# EasyEDA Pro project lr1388-esp32-camera-photometer-7ba3d19c.epro

# Schematic Schematic1
Board Name: 1主控板; Create Date: 2025-08-07; Page Name: P1; Project Name: esp32相机测光计; Schematic Name: Schematic1; Update Date: 2025-08-07; Company: 嘉立创EDA; Page Size: A4; Version: V1.0
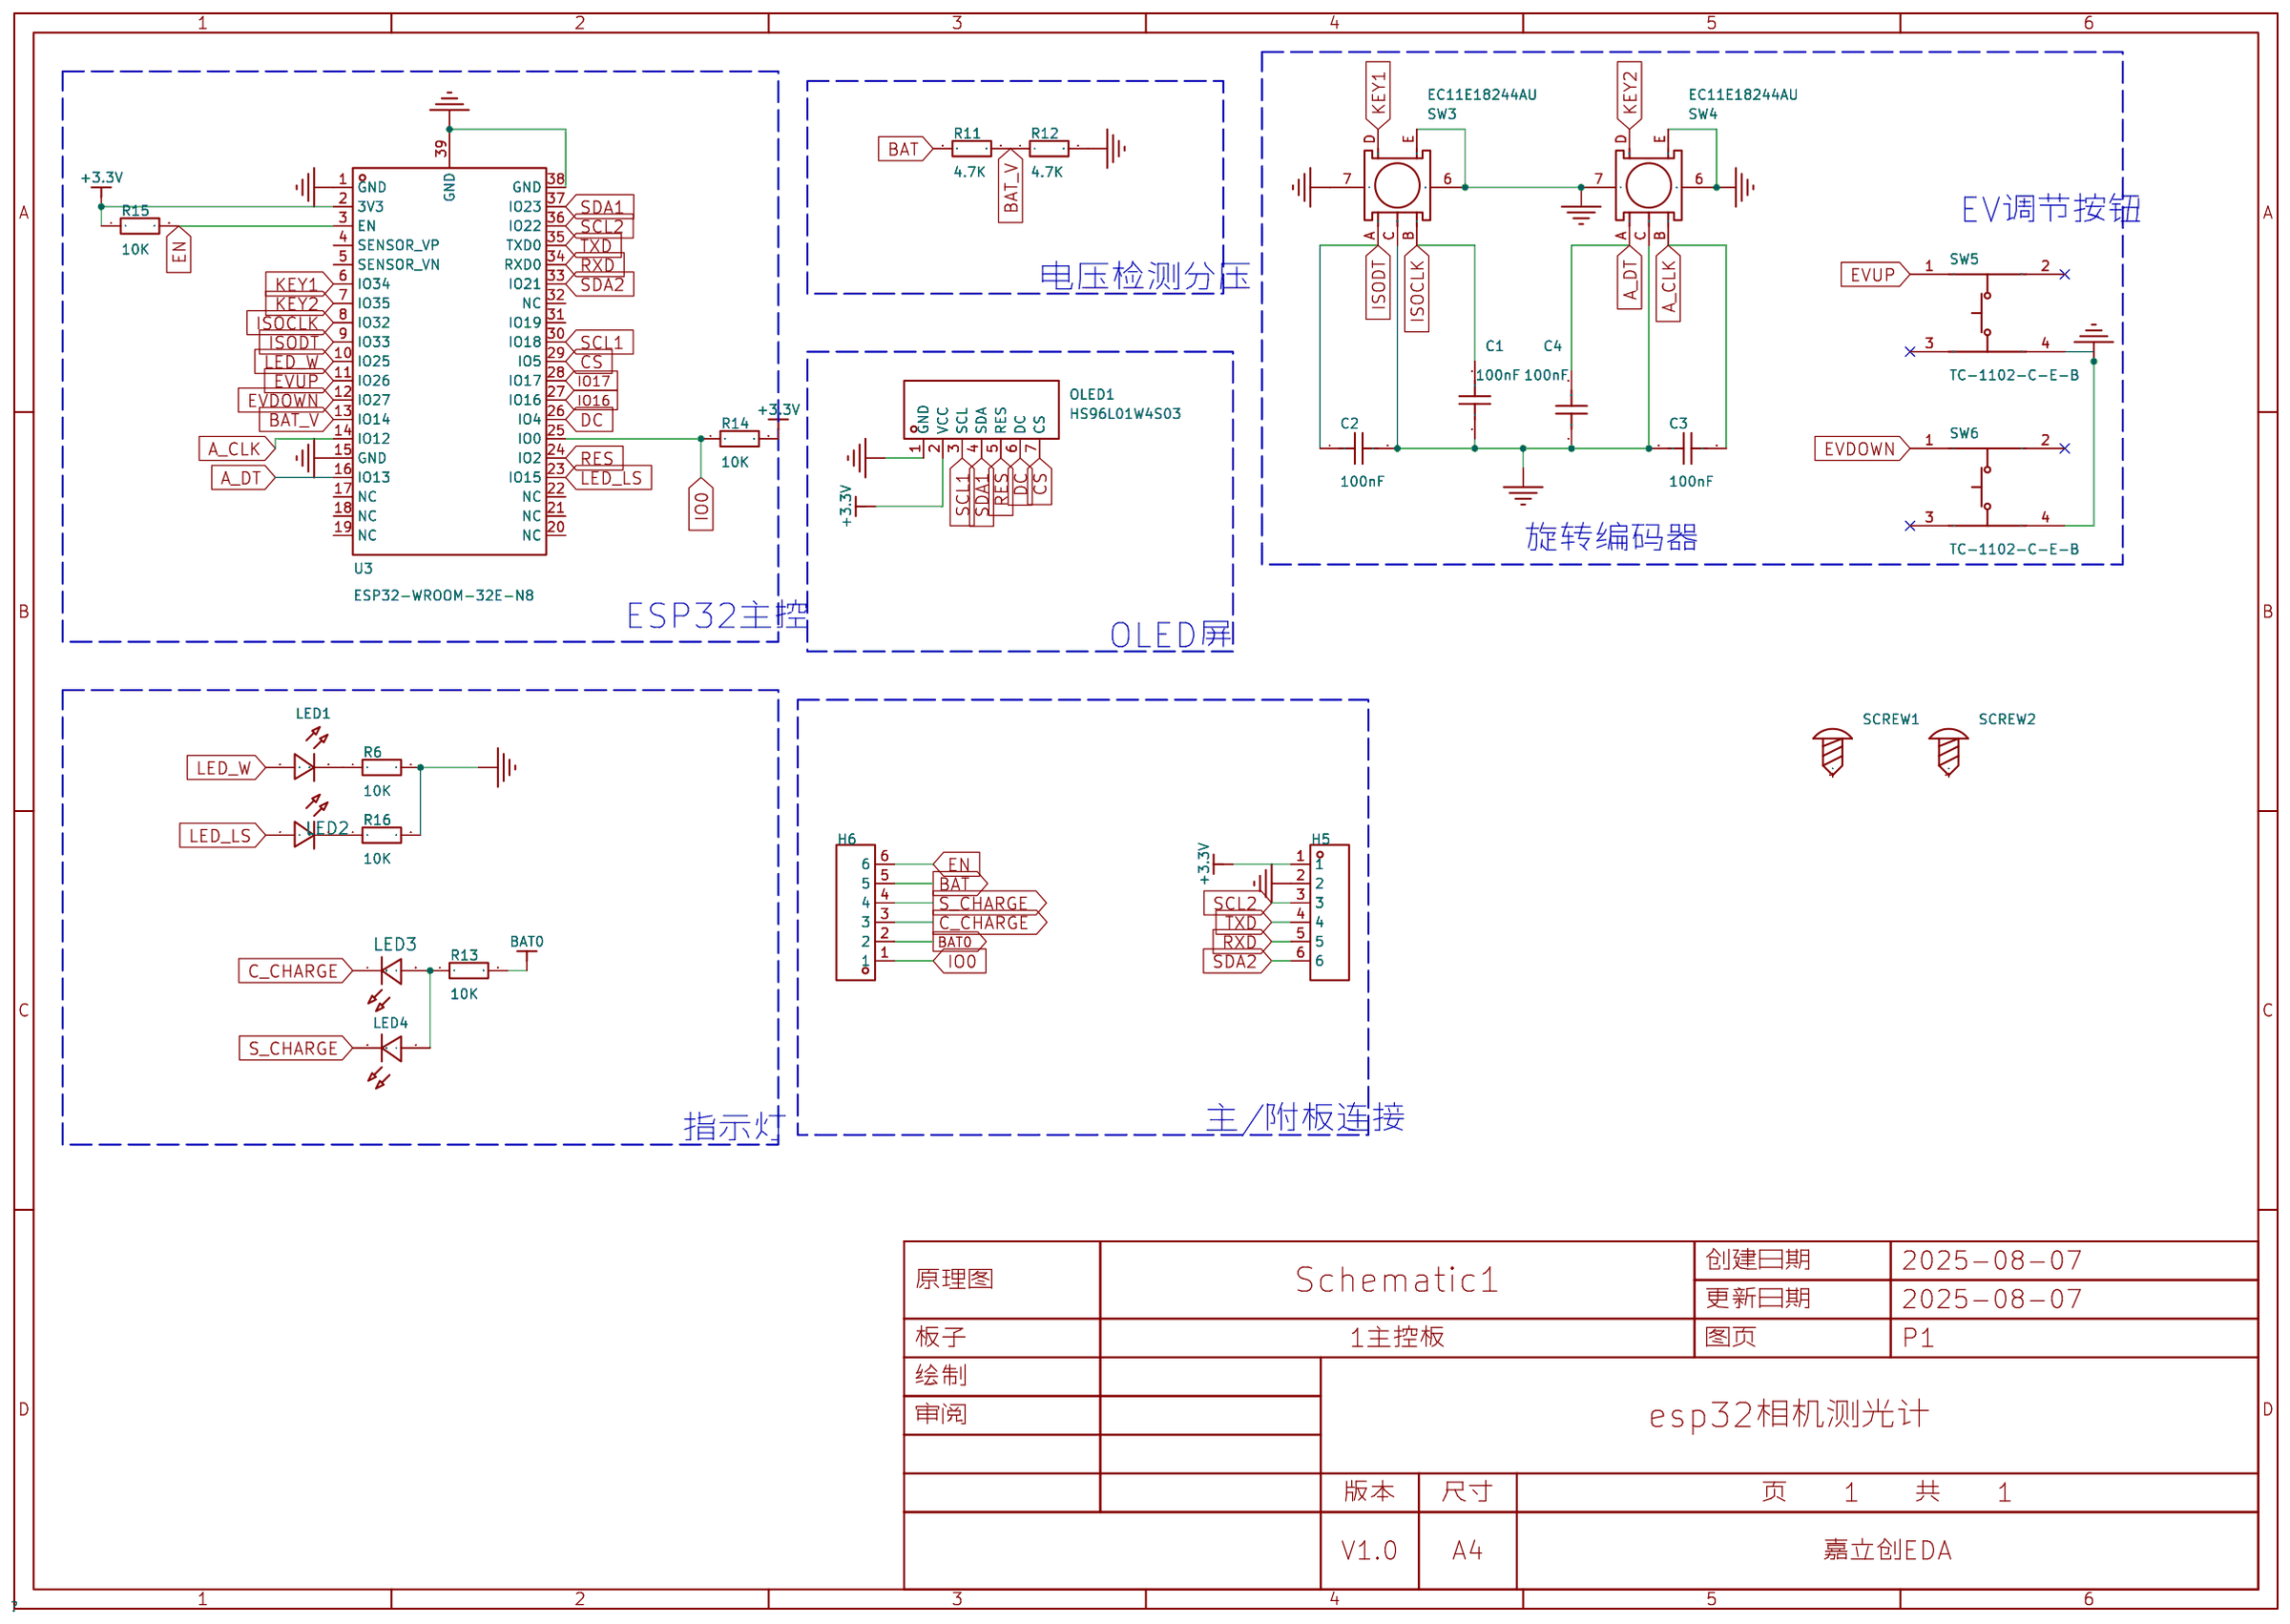
[diagram p0: schematic sheet]

## Parts
C1  100nF  [C0603]
C2  100nF  [C0603]
C3  100nF  [C0603]
C4  100nF  [C0603]
H5  -  [HDR-TH_6P-P2.54-V-F]
H6  -  [HDR-TH_6P-P2.54-V-F]
LED1  -  [LED_0603]
LED2  -  [LED_0603]
LED3  -  [LED_0603]
LED4  -  [LED_0603]
OLED1  HS96L01W4S03  [OLED-TH_HS96L01W4S03]
R6  10K  [R0603]
R11  4.7K  [R0603]
R12  4.7K  [R0603]
R13  10K  [R0603]
R14  10K  [R0603]
R15  10K  [R0603]
R16  10K  [R0603]
SCREW1  -  [M2螺丝]
SCREW2  -  [M2螺丝]
SW3  EC11E18244AU  [SW-TH_EC11XXXXXXXX]
SW4  EC11E18244AU  [SW-TH_EC11XXXXXXXX]
SW5  TC-1102-C-E-B  [KEY-TH_4P-L6.0-W6.0-P4.50-LS6.5]
SW6  TC-1102-C-E-B  [KEY-TH_4P-L6.0-W6.0-P4.50-LS6.5]
U3  ESP32-WROOM-32E-N8  [WIFI-SMD_ESP32-WROOM-32E]

## Library data of the parts
C1-C4 = CAP_0603: Supplier Footprint: 0603
H5 H6 = HDR-F_2.54_1x6P: Supplier Part: C40877; Supplier Footprint: 插件
LED1 LED4 = LED_0603-G: Supplier Footprint: 0603
LED2 LED3 = LED_0603-R: Supplier Footprint: 0603
OLED1 = HS96L01W4S03: LCSC Part Name: 0.96寸 白光 128x64像素分辨率; Supplier Part: C5139758; Manufacturer: HS(汉昇); JLCPCB Part Class: 扩展库; Datasheet: https://atta.szlcsc.com/upload/public/pdf/source/20231102/B1697FD352320B8236C71C910449C6BA.pdf; Supplier: LCSC
R6 R11-R16 = Res_0603: Supplier Footprint: 0603
SCREW1 SCREW2 = M2螺丝: Supplier Footprint: 插件
SW3 SW4 = EC11E18244AU: Supplier Part: C202365; Manufacturer: ALPSALPINE(阿尔卑斯阿尔派); Supplier Footprint: 插件; JLCPCB Part Class: 扩展库; Datasheet: https://atta.szlcsc.com/upload/public/pdf/source/20180403/C202365_70FA927E879F562641EADC151E1E414A.pdf; Supplier: LCSC
SW5 SW6 = TC-1102-C-E-B: 电路结构:单刀单掷;按钮形状:圆形按钮;作用力:260gf;安装方式:直插;开关长度:6mm;开关宽度:6mm;开关高度:6mm;带支架:不带;触点电流:50mA;额定电压(DC):12V;绝缘电阻:-;带灯:无;机械寿命:30万次;; LCSC Part Name: 6*6*6mm 直插 轻触开关; Supplier Part: C381011; Manufacturer: XKB Connectivity(中国星坤); Supplier Footprint: 插件; JLCPCB Part Class: 扩展库; Datasheet: https://atta.szlcsc.com/upload/public/pdf/source/20211011/5338952D91EAA82439B0E0118625537B.pdf; Supplier: LCSC; Circuit: 单刀单掷; Actuator Style: 圆形按钮; Operating Force: 260gf; Mounting Style: 直插; Switch Length: 6mm; Switch Width: 6mm; Switch Height: 6mm; Strike Gundam: 不带; Contact Current: 50mA; Voltage Rating (DC): 12V; Actuator/Cap Color: 黑色; With Lamp: 无; Pin Style: PC引脚; Mechanical Life: 30万次; Operating Temperature: -30℃~+85℃
U3 = ESP32-WROOM-32E-N8: ESP32-WROOM-32E 集成 ESP32-D0WD-V3 芯片，具有?高的稳定性和安全性能。; LCSC Part Name: 通用型Wi-Fi+BT+BLE MCU模组; Supplier Part: C701342; Manufacturer: ESPRESSIF(乐鑫); Supplier Footprint: SMD,18x25.5mm; JLCPCB Part Class: 扩展库; Datasheet: https://atta.szlcsc.com/upload/public/pdf/source/20240307/DEBA00FAE5BA634F0D73085E4F214E93.pdf; Supplier: LCSC

## Nets
+3.3V: H5.1 OLED1.2(VCC) R14.2 R15.1 U3.2(3V3)
GND: C1.1 C2.2 C3.1 C4.1 H5.2 OLED1.1(GND) R6.2 R12.2 R16.2 SW3.6 SW3.7 SW3.C SW3.E SW4.6 SW4.7 SW4.C SW4.E SW5.4 SW6.4 U3.1(GND) U3.15(GND) U3.38(GND) U3.39(GND)
A_CLK: C3.2 SW4.B U3.14(IO12)
A_DT: C4.2 SW4.A U3.16(IO13)
BAT: H6.5 R11.1
BAT0: H6.2 R13.2
BAT_V: R11.2 R12.1 U3.13(IO14)
C_CHARGE: H6.3 LED3.1(C)
CS: OLED1.7(CS) U3.29(IO5)
DC: OLED1.6(DC) U3.26(IO4)
EN: H6.6 R15.2 U3.3(EN)
EVDOWN: SW6.1 U3.12(IO27)
EVUP: SW5.1 U3.11(IO26)
IO0: H6.1 R14.1 U3.25(IO0)
IO16: U3.27(IO16)
IO17: U3.28(IO17)
ISOCLK: C1.2 SW3.B U3.8(IO32)
ISODT: C2.1 SW3.A U3.9(IO33)
KEY1: SW3.D U3.6(IO34)
KEY2: SW4.D U3.7(IO35)
LED_LS: LED2.2(A) U3.23(IO15)
LED_W: LED1.2(A) U3.10(IO25)
RES: OLED1.5(RES) U3.24(IO2)
RXD: H5.5 U3.34(RXD0)
S_CHARGE: H6.4 LED4.1(C)
SCL1: OLED1.3(SCL) U3.30(IO18)
SCL2: H5.3 U3.36(IO22)
SDA1: OLED1.4(SDA) U3.37(IO23)
SDA2: H5.6 U3.33(IO21)
TXD: H5.4 U3.35(TXD0)
$1N1695: LED3.2(A) LED4.2(A) R13.1
$1N1722: LED1.1(C) R6.1
$1N1723: LED2.1(C) R16.1

Not connected (* = marked no-connect by the designer): SCREW1 1; SCREW2 1; SW5 2* 3*; SW6 2* 3*; U3 4(SENSOR_VP) 5(SENSOR_VN) 17(NC) 18(NC) 19(NC) 20(NC) 21(NC) 22(NC) 31(IO19) 32(NC)

## Notes on the sheet
- EV调节按钮
- 电压检测分压
- 旋转编码器
- ESP32主控
- OLED屏
- 主/附板连接
- 指示灯

# Schematic Schematic2
Board Name: 2感光板; Create Date: 2025-08-07; Page Name: P1; Project Name: esp32相机测光计; Schematic Name: Schematic2; Update Date: 2025-08-14; Company: 嘉立创EDA; Page Size: A4; Version: V1.0
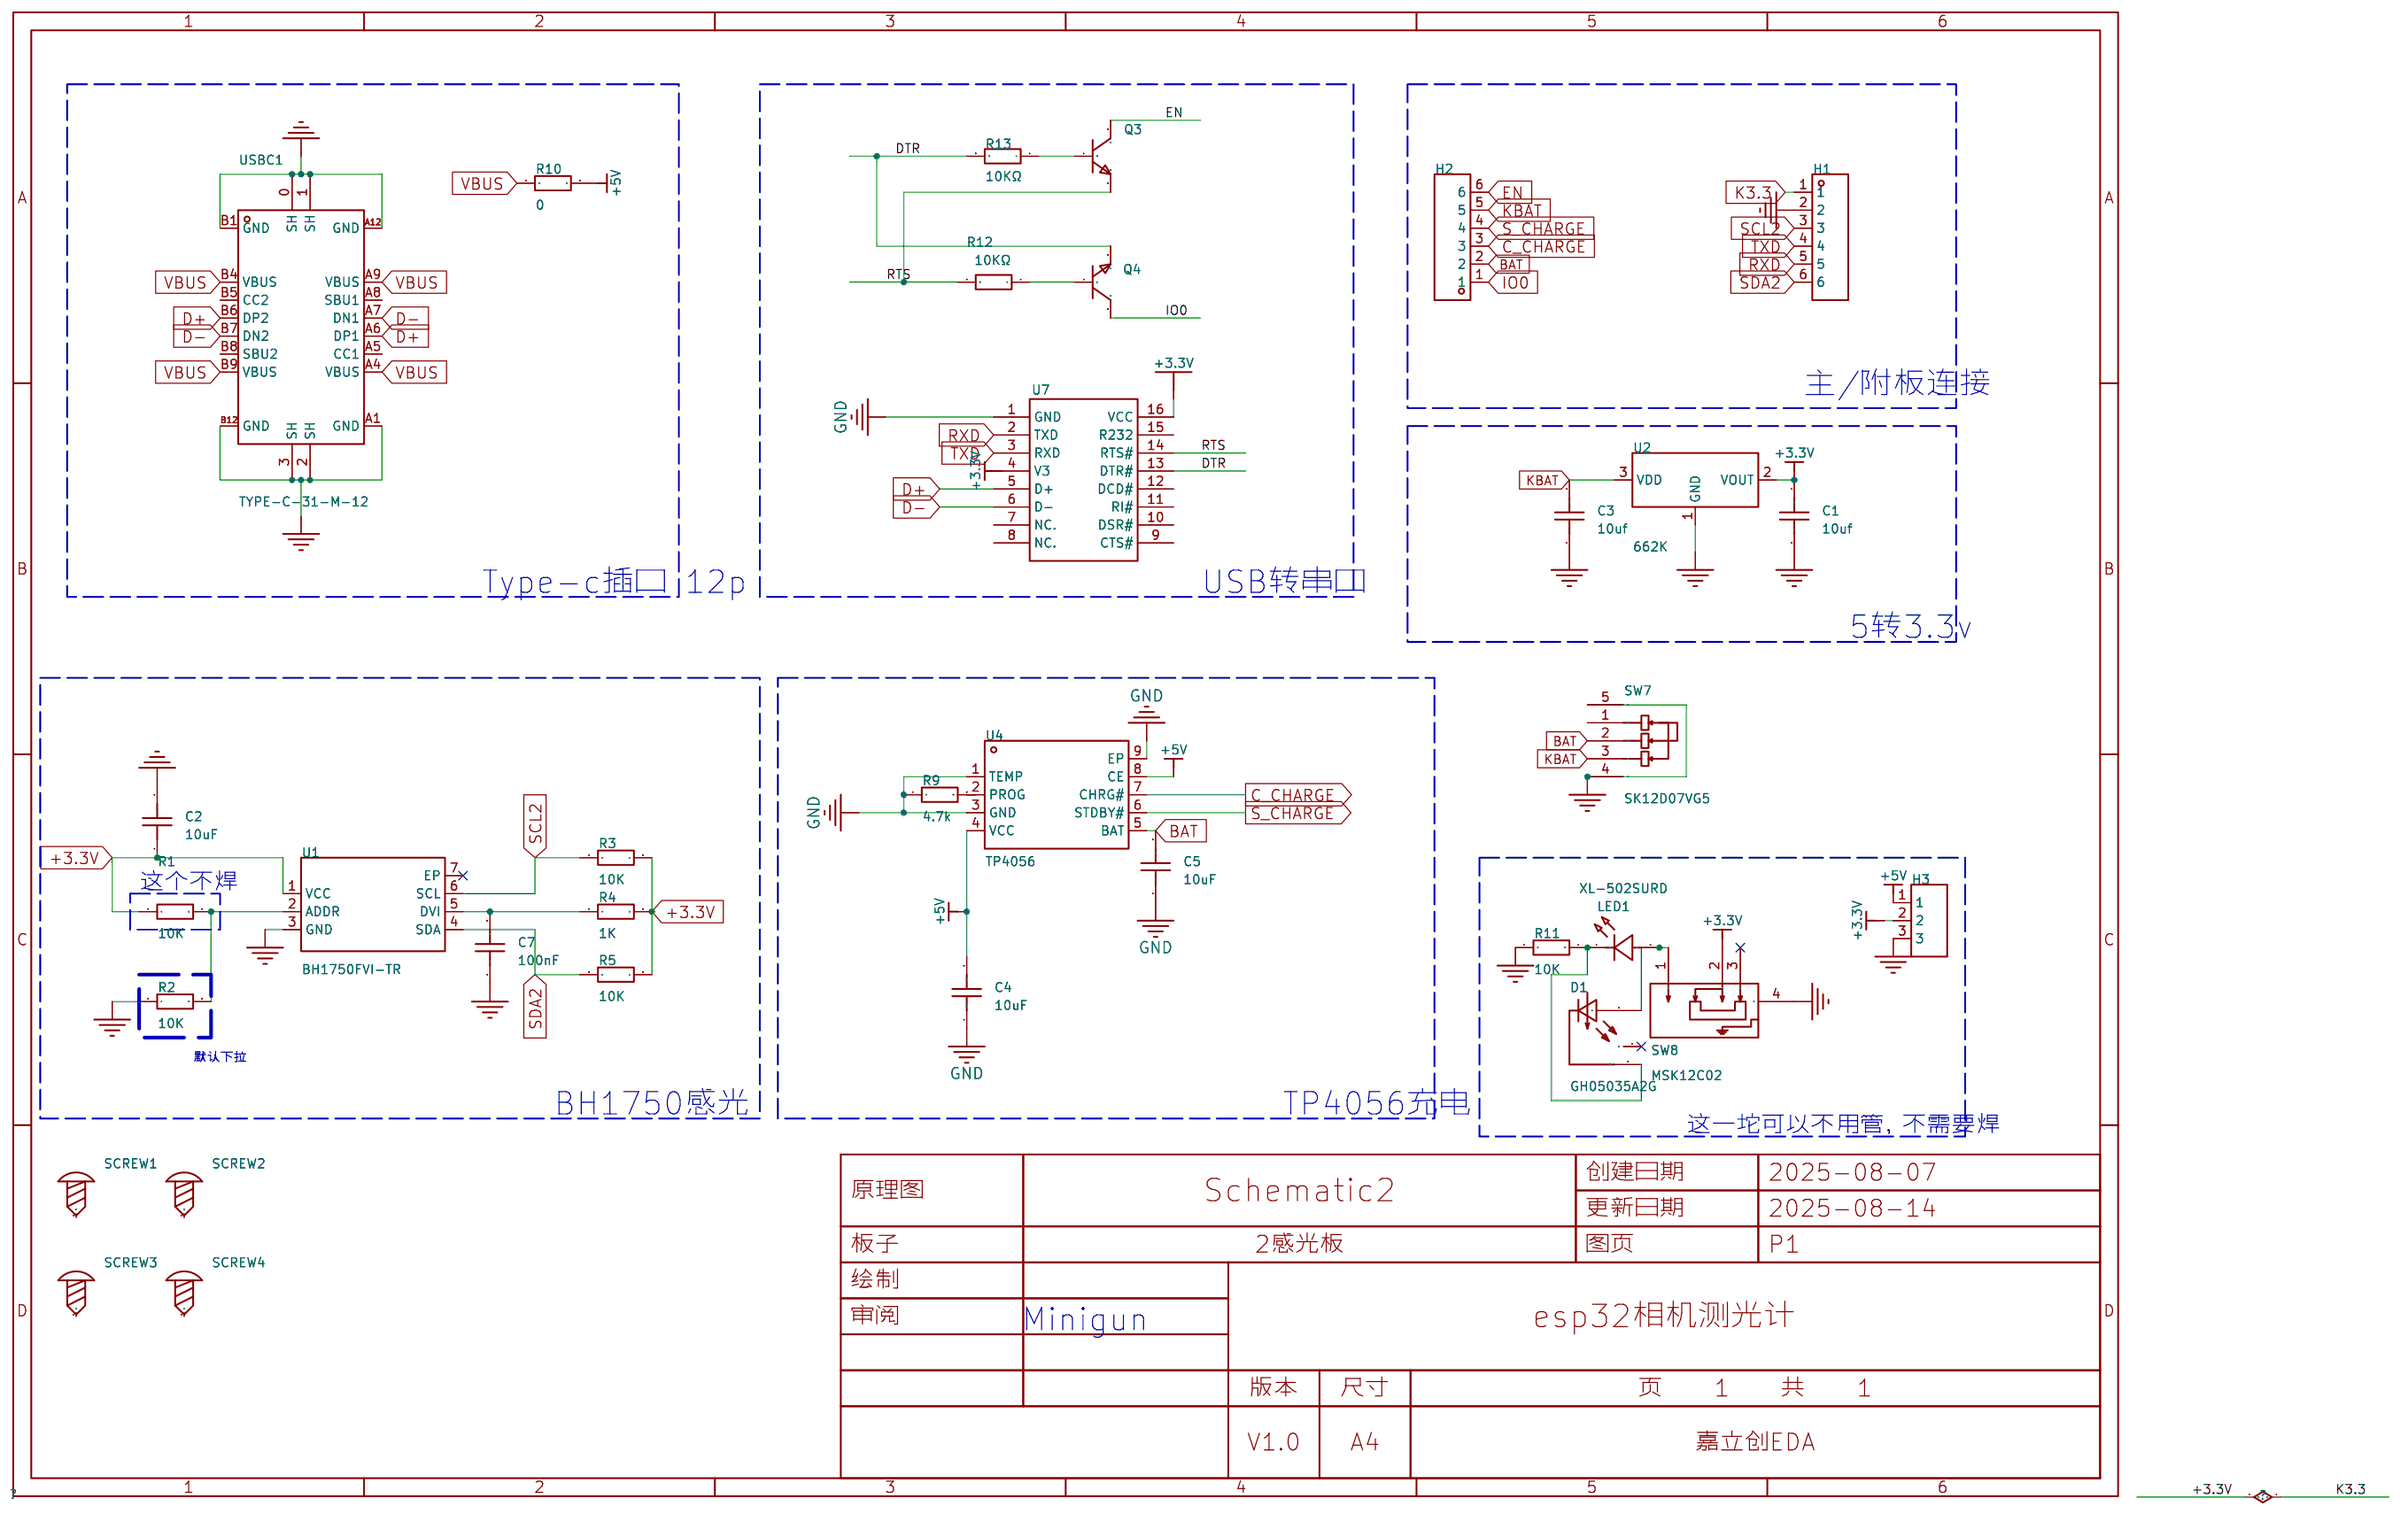
[diagram p1: schematic sheet]

## Parts
C1  10uf  [C0603]
C2  10uF  [C0603]
C3  10uf  [C0603]
C4  10uF  [C0603]
C5  10uF  [C0603]
C7  100nF  [C0603]
D1  GH05035A2G  [OPTO-TH_GH05035A2G]
H1  -  [HDR-TH_6P-P2.54-V-F]
H2  -  [HDR-TH_6P-P2.54-V-F]
H3  -  [HDR-TH_3P-P2.54-V-F]
LED1  XL-502SURD  [LED-TH_BD5.9-P2.54-RD_RED]
Q3  -  [SOT-23-3_L2.9-W1.6-P1.90-LS2.8-BR]
Q4  -  [SOT-23-3_L2.9-W1.6-P1.90-LS2.8-BR]
R1  10K  [R0603]
R2  10K  [R0603]
R3  10K  [R0603]
R4  1K  [R0603]
R5  10K  [R0603]
R9  4.7k  [R0603]
R10  0  [R0603]
R11  10K  [R1206]
R12  10KΩ  [R0603_2]
R13  10KΩ  [R0603_2]
SCREW1  -  [M3螺丝]
SCREW2  -  [M3螺丝]
SCREW3  -  [M3螺丝]
SCREW4  -  [M3螺丝]
SW7  SK12D07VG5  [SW-TH_SK12D07VG5]
SW8  MSK12C02  [SW-TH_MSK12C02]
U1  BH1750FVI-TR  [WSOF-6_L2.6-W1.6-P0.50-TL-EP]
U2  662K  [SOT-23-3_L2.9-W1.3-P1.90-LS2.4-BR]
U4  TP4056  [ESOP-8_L4.9-W3.9-P1.27-LS6.0-BL-EP]
U7  -  [SOP-16_L10.0-W3.9-P1.27-LS6.0-BL]
USBC1  TYPE-C-31-M-12  [USB-C_SMD-TYPE-C-31-M-12]

## Library data of the parts
C1-C5 C7 = CAP_0603: Supplier Footprint: 0603
D1 = GH05035A2G: 波长:505nm;工作电压:6V;工作电流:125mA;阈值电流:70mA;; LCSC Part Name: 505nm 角度:水平8.5° 垂直23°的激光二极管; Supplier Part: C473922; Manufacturer: SHARP(夏普); JLCPCB Part Class: 扩展库; Datasheet: https://atta.szlcsc.com/upload/public/pdf/source/20200106/C473922_B43BBD77573876EB9E3AA67C2730385F.pdf; Supplier: LCSC; Wavelength: 505nm; Voltage - Supply: 6V; Current - Supply: 125mA; Threshold current: 70mA; Operating Temperature: -10℃~+60℃
H1 H2 = HDR-F_2.54_1x6P: Supplier Part: C40877; Supplier Footprint: 插件
H3 = HDR-F_2.54_1x3P: Supplier Part: C541850; Supplier Footprint: 插件
LED1 = XL-502SURD: 灯头类型:5mm圆形灯头;发光颜色:红色;正向电压(VF):2.4V;功率:80mW;正向电流:20mA;主波长:-;透镜颜色:红色透镜;色温:-;发光强度:300mcd;发光角度:35°;载带方式:-;工作温度:-25℃~+85℃;; Supplier Part: C2895492; Manufacturer: XINGLIGHT(成兴光); Supplier Footprint: 插件,D=5mm; JLCPCB Part Class: 扩展库; Datasheet: https://atta.szlcsc.com/upload/public/pdf/source/20220816/7D3B6C5DAA6D3D612C28AF3454ED9DF8.pdf; Supplier: LCSC; Lamp Holder Type: 5mm圆形灯头; Emitted Color: 红色; Forward Voltage (VF): 2.4V; Power Dissipation: 80mW; Forward Current: 20mA; Peak Wavelength: 654nm; Lens Color: 红色透镜; Luminous Intensity: 300mcd; Viewing Angle: 35°; Operating Temperature: -25℃~+85℃
Q3 Q4 = SS8050: LCSC Part Name: SS8050SOT-23 SOT-23; Supplier Part: C2848182; Manufacturer: IDCHIP(英锐芯); Supplier Footprint: SOT-23; JLCPCB Part Class: Extended Part; Datasheet: https://atta.szlcsc.com/upload/public/pdf/source/20210721/C2848182_EAB0433D611E0F01C7FC2F1131311000.pdf; Supplier: LCSC
R1-R5 R9 R10 = Res_0603: Supplier Footprint: 0603
R11 = Res_1206: Supplier Footprint: 1206
R12 R13 = 贴片电阻-0603: 电阻类型:厚膜电阻;阻值:806Ω;精度:±1%;功率:1/10W;温度系数:±100ppm/;最大工作电压:50V;工作温度范围:-55~+125;; LCSC Part Name: 806Ω ±1%; Supplier Part: C101197; Manufacturer: LIZ(丽智电子); Manufacturer Part: CR0603FA8060G; Supplier Footprint: 0603; JLCPCB Part Class: Extended Part; Datasheet: https://atta.szlcsc.com/upload/public/pdf/source/20170408/1491631423717.pdf; Supplier: LCSC; Type: 厚膜电阻; Tolerance: ±1%; Power(Watts): 1/10W; Temperature Coefficient: ±100ppm/; Overload Voltage (Max): 50V; Operating Temperature Range: -55~+125
SCREW1-SCREW4 = M3螺丝: Supplier Footprint: 插件
SW7 = SK12D07VG5: 电路结构:单刀双掷;安装方式:侧插;开关颜色:-;额定电流(DC):500mA;额定电压(DC):50V;额定电流(AC):-;额定电压(AC):-;机械寿命:5千次;; LCSC Part Name: 两档位卧式拨动开关,柄长5MM; Supplier Part: C431548; Manufacturer: SHOU HAN(首韩); Supplier Footprint: 插件; JLCPCB Part Class: 扩展库; Datasheet: https://atta.szlcsc.com/upload/public/pdf/source/20190925/C431548_D6571AEBDE139FDB1E6F8A4B1513A630.pdf; Supplier: LCSC; Circuit: 单刀双掷; Pin Style: PC引脚; Switch Length: 8.7mm; Switch Width: 4.4mm; Switch Height: 4.7mm; Mounting Style: 侧插; Current Rating (DC): 500mA; Voltage Rating (DC): 50V; Mechanical Life: 5千次; Operating Temperature: -10℃~+50℃
SW8 = MSK12C02: 电路结构:单刀双掷;安装方式:卧贴;开关颜色:-;额定电流(DC):50mA;额定电压(DC):12V;额定电流(AC):-;额定电压(AC):-;机械寿命:1万次;; LCSC Part Name: 两档侧拨贴片 7脚 滑动开关; Supplier Part: C431540; Manufacturer: SHOU HAN(首韩); Supplier Footprint: SMD; JLCPCB Part Class: 扩展库; Datasheet: https://atta.szlcsc.com/upload/public/pdf/source/20190925/C431540_89155AEF0758B9AD1B2D805F83FB12E3.pdf; Supplier: LCSC; Circuit: 单刀双掷; Pin Style: SMD接片; Switch Length: 8mm; Switch Width: 2.8mm; Switch Height: 1.4mm; Mounting Style: 卧贴; Current Rating (DC): 50mA; Voltage Rating (DC): 12V; Mechanical Life: 1万次; Operating Temperature: -20℃~+70℃
U1 = BH1750FVI-TR: 检测颜色:-;接口类型:I2C;分辨率(位):16;; Supplier Part: C78960; Manufacturer: ROHM(罗姆); Supplier Footprint: WSOF-6; JLCPCB Part Class: 扩展库; Datasheet: https://atta.szlcsc.com/upload/public/pdf/source/20160723/1469258984787.pdf; Supplier: LCSC; Interface Type: I2C; Supply Voltage: 2.4V~3.6V; Resolution: 16; Operating Temperature: -40℃~+85℃
U2 = 662K: 输出类型:固定;工作电压:8V;输出电压:3.3V;输出电流:300mA;输出极性:正极;; LCSC Part Name: 662K. 输入8V 300mA; Supplier Part: C7470756; Manufacturer: HXY MOSFET(华轩阳电子); Supplier Footprint: SOT-23; JLCPCB Part Class: 扩展库; Datasheet: https://atta.szlcsc.com/upload/public/pdf/source/20230915/BA72989D17401E2852D389BF12EDF43F.pdf; Supplier: LCSC; Output Type: 固定; Voltage - Supply: 8V; Output Voltage: 3.3V; Output Current: 300mA; Features: 过流保护(OCP); Output Configuration: 正极; Number of Outputs: 1
U4 = TP4056_C725790: Supplier Part: C725790; Manufacturer: UMW(友台半导体); Supplier Footprint: ESOP-8; JLCPCB Part Class: Extended Part; Datasheet: https://atta.szlcsc.com/upload/public/pdf/source/20211011/37515E71BA298E23D23475482C49633D.pdf; Supplier: LCSC
U7 = CH340C: 类型:Transceiver;协议类别:USB 2.0;驱动器/接收器数:-;数据速率:2Mbps;; Supplier Part: C84681; Manufacturer: WCH(南京沁恒); Supplier Footprint: SOP-16_150mil; JLCPCB Part Class: Extended Part; Datasheet: https://atta.szlcsc.com/upload/public/pdf/source/20200819/C84681_ADBED554CE321879DBD6B1D06488689C.pdf; Supplier: LCSC; Type: Transceiver; Protocol: USB 2.0; Data Rate: 2Mbps; Supply Voltage: 3.3V, 5V
USBC1 = TYPE-C-31-M-12: 连接器类型:Type-C;标准:-;公母:母;安装方式:-;触点数量:16P;端口数量:1;额定电流 - 电源:5A;工作温度范围:-;; LCSC Part Name: Type-C 母; Supplier Part: C165948; Manufacturer: 韩国韩荣; Supplier Footprint: SMD; JLCPCB Part Class: 扩展库; Datasheet: https://atta.szlcsc.com/upload/public/pdf/source/20220525/466408E853115E789EDB0DDC29077C05.pdf; Supplier: LCSC; Connector Type: Type-C; Gender: 母; Number of Contacts: 16P; Number of Ports: 1; Current Rating - Power (Max): 5A

## Nets
+3.3V: C1.1 C2.1 H1.1 H3.2 R1.1 R3.2 R4.2 R5.2 SW8.2 U1.1(VCC) U2.2(VOUT) U7.4(V3) U7.16(VCC)
+5V: C4.2 H3.1 R10.2 U4.4(VCC) U4.8(CE)
GND: C1.2 C2.2 C3.1 C4.1 C5.1 C7.1 H1.2 H3.3 R2.1 R9.1 R11.2 SW7.4 SW7.5 SW8.4 U1.3(GND) U2.1(GND) U4.1(TEMP) U4.3(GND) U4.9(EP) U7.1(GND) USBC1.0(SH) USBC1.1(SH) USBC1.2(SH) USBC1.3(SH) USBC1.A1(GND) USBC1.A12(GND) USBC1.B1(GND) USBC1.B12(GND)
VBUS: R10.1 USBC1.A4(VBUS) USBC1.A9(VBUS) USBC1.B4(VBUS) USBC1.B9(VBUS)
BAT: C5.2 H2.2 SW7.2 U4.5(BAT)
C_CHARGE: H2.3 U4.7(CHRG#)
D+: U7.5(D+) USBC1.A6(DP1) USBC1.B6(DP2)
D-: U7.6(D-) USBC1.A7(DN1) USBC1.B7(DN2)
DTR: Q4.2(E) R13.2 U7.13(DTR#)
EN: H2.6 Q3.3(C)
IO0: H2.1 Q4.3(C)
KBAT: C3.2 H2.5 SW7.3 U2.3(VDD)
RTS: Q3.2(E) R12.2 U7.14(RTS#)
RXD: H1.5 U7.2(TXD)
S_CHARGE: H2.4 U4.6(STDBY#)
SCL2: H1.3 R3.1 U1.6(SCL)
SDA2: H1.6 R5.1 U1.4(SDA)
TXD: H1.4 U7.3(RXD)
$1N1901: R9.2 U4.2(PROG)
$1N1922: R1.2 R2.2 U1.2(ADDR)
$1N1925: C7.2 R4.1 U1.5(DVI)
$1N1947: D1.1(A) LED1.2(A) SW8.1
$1N1948: D1.3(K) LED1.1(K) R11.1
$1N1969: Q4.1(B) R12.1
$1N1970: Q3.1(B) R13.1

Not connected (* = marked no-connect by the designer): D1 2(K)*; SCREW1 1; SCREW2 1; SCREW3 1; SCREW4 1; SW7 1; SW8 3*; U1 7(EP)*; U7 7(NC.) 8(NC.) 9(CTS#) 10(DSR#) 11(RI#) 12(DCD#) 15(R232); USBC1 A5(CC1) A8(SBU1) B5(CC2) B8(SBU2)

## Notes on the sheet
- 主/附板连接
- Type-c插口 12p
- USB转串口
- 5转3.3v
- 这个不焊
- 默认下拉
- BH1750感光
- TP4056充电
- 这一坨可以不用管，不需要焊
- Minigun

# Board PCB1
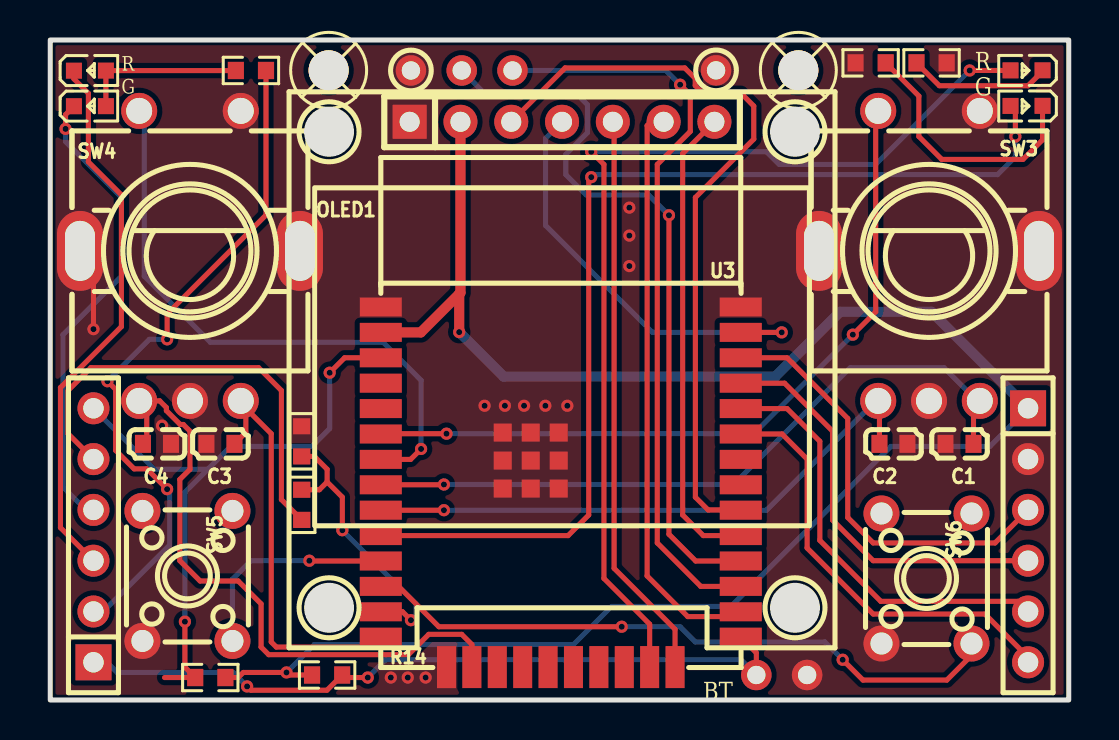
[diagram p2: board, top side]
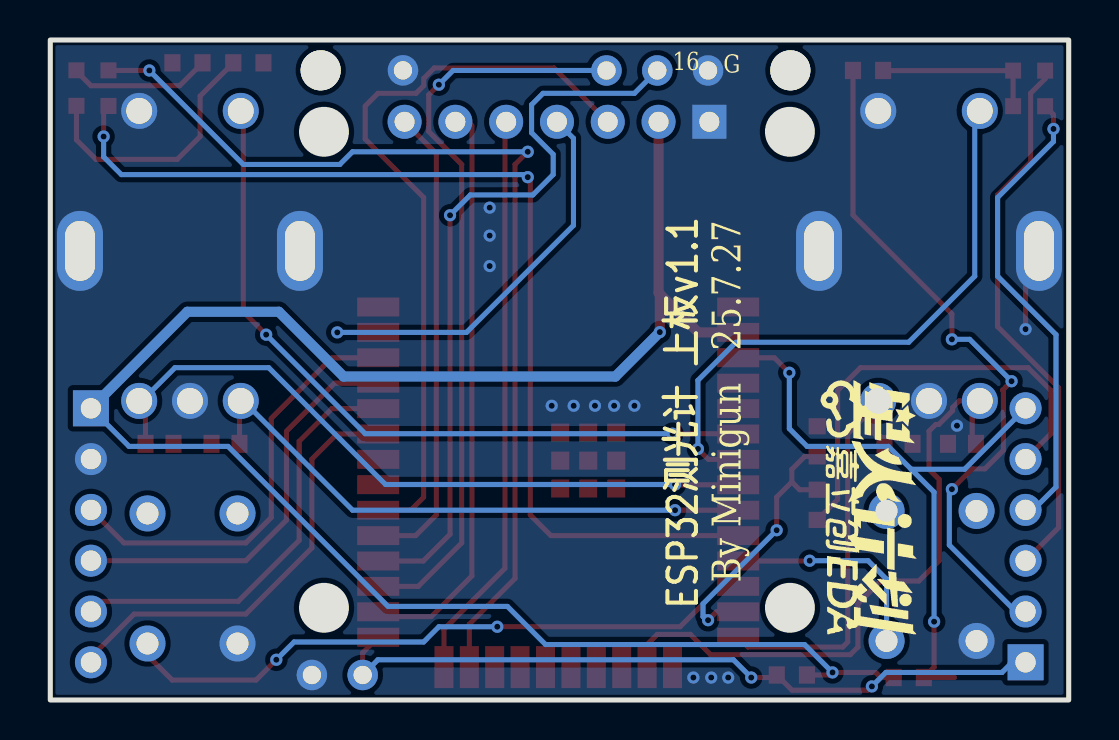
[diagram p3: board, bottom side, seen from below]

Outline 50.93 x 33 mm; copper layers: Top Layer, Bottom Layer. Coordinates in mm from the lower left corner of the outline.
Outline path: rectangle 0,33 50.93,0
Stack: Top Layer 0.035mm / Dielectric1 1.51mm FR4 er 4.5 / Bottom Layer 0.035mm

## Design rules (mm)
spacing copperThickness1oz (default): track to track 0.102, other pairs 0.152 to 0.3
spacing copperThickness2oz: track to track 0.203, other pairs 0.152 to 0.3
spacing Plane_innerPlane: track to track 0.102, other pairs 0.152 to 0.3
spacing Copper_copperRegion: track to track 0.102, other pairs 0.152 to 0.3
track width copperThickness1oz (default): min 0.127, default 0.254, max 2.54
track width copperThickness2oz: min 0.203, default 0.254, max 2.54
differential pair differentialPair (default): width min 0.127, default 0.254, max 2.54; gap min 0.152, default 0.152
pour e310 uses Copper_copperRegion
pour e318 uses Copper_copperRegion

## Placement (name value [footprint] x y rotation side)
C1  100nF  [C0603]  45.47 12.81 0 top
C2  100nF  [C0603]  42.16 12.81 0 top
C3  100nF  [C0603]  8.51 12.81 0 top
C4  100nF  [C0603]  5.33 12.81 180 top
H5  -  [HDR-TH_6P-P2.54-V-F]  48.9 8.23 270 top
H6  -  [HDR-TH_6P-P2.54-V-F]  2.16 8.23 90 top
LED1  -  [LED_0603]  48.77 29.7 180 top
LED2  -  [LED_0603]  48.77 31.48 180 top
LED3  -  [LED_0603]  2.03 31.48 0 top
LED4  -  [LED_0603]  2.03 29.7 0 top
NOREF  -  [Pad_e38]  23.11 31.48 0 top
NOREF#2  -  [Pad_e39]  33.29 31.48 0 top
NOREF#3  -  [Pad_e41]  37.85 1.25 0 top
NOREF#4  -  [Pad_e37]  20.57 31.48 0 top
NOREF#5  -  [Pad_e40]  35.31 1.25 0 top
NOREF#6  -  [Pad_e36]  18.03 31.48 0 top
OLED1  HS96L01W4S03  [OLED-TH_HS96L01W4S03]  25.59 28.91 0 top
R6  10K  [R0603]  41.02 31.86 180 top
R11  4.7K  [R0603]  12.57 9.76 90 top
R12  4.7K  [R0603]  12.57 12.93 90 top
R13  10K  [R0603]  10.03 31.48 0 top
R14  10K  [R0603]  13.84 1.25 180 top
R15  10K  [R0603]  8 1.12 180 top
R16  10K  [R0603]  44.07 31.86 0 top
SCREW1  -  [M2螺丝]  37.41 31.48 0 top
SCREW2  -  [M2螺丝]  13.92 31.48 0 top
SW3  EC11E18244AU  [SW-TH_EC11XXXXXXXX]  43.94 22.2 0 top
SW4  EC11E18244AU  [SW-TH_EC11XXXXXXXX]  6.98 22.2 0 top
SW5  TC-1102-C-E-B  [KEY-TH_4P-L6.0-W6.0-P4.50-LS6.5]  6.86 6.2 90 top
SW6  TC-1102-C-E-B  [KEY-TH_4P-L6.0-W6.0-P4.50-LS6.5]  43.81 6.08 90 top
U3  ESP32-WROOM-32E-N8  [WIFI-SMD_ESP32-WROOM-32E]  25.53 10.65 270 top

## Footprints (pads in the part's own frame, mm; a bottom-side part is the same pattern mirrored in y, then rotated)
C0603
  rect 0.8x0.9 smd: 1(-0.7,0) 2(0.7,0)
HDR-TH_6P-P2.54-V-F
  rect 1.8x1.8 hole 1.02: 1(-6.35,0)
  round 1.6 hole 1.02: 2(-3.81,0) 3(-1.27,0) 4(1.27,0) 5(3.81,0) 6(6.35,0)
KEY-TH_4P-L6.0-W6.0-P4.50-LS6.5
  round 1.8 hole 1.1: 1(-3.251,-2.251) 2(3.251,-2.251) 3(3.251,2.251) 4(-3.251,2.251)
LED_0603
  rect 0.8x0.8 smd: 1(-0.851,-0.01) 2(0.75,-0.005)
M2螺丝
  round 2 hole 2: 1(0,0)
OLED-TH_HS96L01W4S03
  rect 1.7x1.7 hole 1: 1(-7.62,0)
  round 1.7 hole 1: 2(-5.08,0) 3(-2.54,0) 4(0,0) 5(2.54,0) 6(5.08,0) 7(7.62,0)
Pad_e36
  round 1.524 hole 0.914: 3(0,0)
Pad_e37
  round 1.524 hole 0.914: 1(0,0)
Pad_e38
  round 1.524 hole 0.914: 1(0,0)
Pad_e39
  round 1.524 hole 0.914: 1(0,0)
Pad_e40
  round 1.524 hole 0.914: 1(0,0)
Pad_e41
  round 1.524 hole 0.914: 2(0,0)
R0603
  rect 0.806x0.864 smd: 1(-0.753,0) 2(0.753,0)
SW-TH_EC11XXXXXXXX
  oval 2.3x4 hole 1.5x3: 6(5.5,0.25) 7(-5.5,0.25)
  round 1.8 hole 1.3: A(-2.54,-7.25) B(2.54,-7.25) C(0,-7.25) D(-2.54,7.25) E(2.54,7.25)
WIFI-SMD_ESP32-WROOM-32E
  rect 0.95x2.1 smd: 1(-9.002,-9) 2(-7.732,-9) 3(-6.463,-9) 4(-5.192,-9) 5(-3.922,-9) 6(-2.652,-9) 7(-1.383,-9) 8(-0.113,-9) 9(1.157,-9) 10(2.428,-9) 11(3.697,-9) 12(4.968,-9) 13(6.237,-9) 14(7.508,-9) 25(7.508,9) 26(6.237,9) 27(4.968,9) 28(3.697,9) 29(2.428,9) 30(1.157,9) 31(-0.113,9) 32(-1.383,9) 33(-2.652,9) 34(-3.922,9) 35(-5.192,9) 36(-6.463,9) 37(-7.732,9) 38(-9.002,9)
  rect 2.1x0.95 smd: 15(9.002,-5.715) 16(9.002,-4.445) 17(9.002,-3.175) 18(9.002,-1.905) 19(9.002,-0.635) 20(9.002,0.635) 21(9.002,1.905) 22(9.002,3.175) 23(9.002,4.445) 24(9.002,5.715)
  rect 0.9x0.9 smd: 39(-2.721,-0.1) 39(-2.721,-1.5) 39(-2.721,-2.9) 39(-1.321,-0.1) 39(-1.321,-1.5) 39(-1.321,-2.9) 39(0.079,-0.1) 39(0.079,-1.5) 39(0.079,-2.9)

## Nets
As in the schematic, except:
GND: C1.1 C2.2 C3.1 C4.1 H5.2 NOREF#2.1 NOREF#3.2 NOREF#6.3 OLED1.1 R6.2 R12.2 R16.2 SW3.6 SW3.7 SW3.C SW3.E SW4.6 SW4.7 SW4.C SW4.E SW5.4 SW6.4 U3.1 U3.15 U3.38 U3.39
IO0: H6.1 NOREF#5.1 R14.1 U3.25
IO16: NOREF.1 U3.27
IO17: NOREF#4.1 U3.28

Pads without a net: SCREW1 1; SCREW2 1; SW5 2 3; SW6 2 3; U3 4 5 17 18 19 20 21 22 31 32

## Via types
v1: diameter 0.61, hole 0.305, Top Layer to Bottom Layer, 40 vias

## Routing (per net, layer and track width the routed paths; a pad name or vN(x,y) marks a point on that pad's centre or on a via; arc(x,y) is an arc through that point)
+3.3V: length 95
  Top Layer w0.254: R15.1 9.4,1.12 9.65,1.38 v1(11.81,1.38) 11.94,1.25 R14.2
  Top Layer w0.508: OLED1.2 20.51,20.36 20.45,20.3 ; U3.2 18.53,18.38 20.45,20.3 ; v1(20.45,18.39) 20.45,20.3
  Bottom Layer w0.254: v1(11.81,1.38) 13.21,2.77 26.16,2.77 28.07,4.68 34.04,4.68 42.04,12.68 46.99,12.68 H5.1
  Bottom Layer w0.508: H5.1 44.07,19.41 39.5,19.41 36.26,16.17 22.67,16.17 v1(20.45,18.39)
GND: length 4.2
  Top Layer w0.254: v1(2.16,18.54) 2.16,21.78 SW4.7
  vias: v1(5.59,13.72) v1(17.03,1.12) v1(17.88,1.12) v1(18.77,1.12) v1(21.72,14.71) v1(22.73,14.71) v1(23.69,14.71) v1(24.76,14.71) v1(25.85,14.71) v1(28.96,24.62) v1(28.96,23.22) v1(28.96,21.7)
A_CLK: length 20.4
  Top Layer w0.254: U3.14 16.03,2.65 11.3,2.65 11.05,2.9 11.05,13.31 9.78,14.58 ; 9.78,14.58 9.78,14.95 ; 9.78,14.58 9.78,13.38 C3.2
A_DT: length 31.4
  Top Layer w0.254: U3.16 21.08,2.77 20.57,3.28 18.92,3.28 17.91,2.27 10.92,2.27 10.54,2.65 10.54,4.81 9.4,5.95 7.49,5.95 6.48,6.97 6.48,11.03 6.98,11.54 6.98,13.44 6.65,13.78 6.5,13.78 5.81,14.47 5.81,14.62 5.47,14.95 4.83,14.95 4.83,12.87 4.76,12.81 C4.2
BAT: length 22.5
  Top Layer w0.254: H6.5 0.89,13.31 0.89,15.47 2.03,16.62 10.41,16.62 11.56,15.47 11.56,10.02 R11.1
BAT0: length 34.4
  Top Layer w0.254: R13.2 10.79,24.25 5.84,19.3 v1(5.84,18.03) ; v1(2.86,15.94) 3.3,15.49 3.3,15.48 3.27,15.44 3.27,12.48 4.19,11.56 4.83,11.56 v1(5.84,10.54)
  Bottom Layer w0.254: H6.2 2.65,4.42 5.97,7.75 5.97,10.41 v1(5.84,10.54) ; v1(2.86,15.94) 4.95,18.03 v1(5.84,18.03)
BAT_V: length 14.2
  Top Layer w0.254: U3.13 17.62,4.41 v1(18.03,3.99) ; 13.84,10.9 14.6,10.14 v1(14.6,8.49) ; 13.84,10.9 13.45,10.51 R11.2 ; 13.84,10.9 13.84,11.54 13.2,12.18 R12.1
  Bottom Layer w0.254: v1(14.6,8.49) 18.29,4.81 18.29,4.17 18.21,4.17 v1(18.03,3.99)
C_CHARGE: length 27.4
  Top Layer w0.254: LED3.1 1.18,31.06 1.91,30.33 1.91,26.9 3.56,25.25 3.56,18.67 0.51,15.62 0.51,8.62 H6.3
CS: length 23.6
  Top Layer w0.254: OLED1.7 31.62,27.32 31.62,9.25 32.65,8.22 U3.29
DC: length 29
  Top Layer w0.254: OLED1.6 30.04,28.91 29.84,28.72 29.84,6.2 31.88,4.17 33.65,4.17 33.89,4.41 U3.26
EN: length 32.2
  Top Layer w0.254: v1(13.97,16.36) 14.72,17.11 U3.3 ; v1(6.73,3.92) 6.73,1.64 R15.2 5.72,1.12
  Bottom Layer w0.254: 7.87,11.54 6.73,10.39 v1(6.73,3.92) ; 7.87,11.54 5.21,11.54 H6.6 ; 7.87,11.54 9.02,12.68 13.08,12.68 13.97,13.57 v1(13.97,16.36)
EVDOWN: length 32.6
  Top Layer w0.254: SW6.1 46.07,2.23 44.83,1 40.64,1 v1(39.62,2.01) ; v1(28.57,3.66) 19.43,3.66 17.41,5.68 U3.12
  Bottom Layer w0.254: v1(28.57,3.66) 31.5,3.66 32.26,2.9 38.74,2.9 v1(39.62,2.01)
EVUP: length 10.9
  Top Layer w0.254: v1(12.95,6.97) 12.97,6.95 U3.11
  Bottom Layer w0.254: v1(12.95,6.97) 10.03,6.97 9.11,6.04 SW5.1
IO0: length 37
  Top Layer w0.254: v1(9.84,0.68) 10.03,0.49 13.83,0.49 R14.1 14.72,1.12 v1(15.88,1.12) ; NOREF#5.1 35.31,2.36 U3.25
  Bottom Layer w0.254: NOREF#5.1 34.54,2.01 16.76,2.01 v1(15.88,1.12) ; v1(9.84,0.68) 9.14,1.38 3.34,1.38 2.83,1.89 H6.1
IO16: length 37.6
  Top Layer w0.254: U3.27 32.53,5.68 30.35,7.85 30.35,26.78 32,28.43 32,30.26 v1(31.5,30.76)
  Bottom Layer w0.254: v1(31.5,30.76) 30.78,31.48 NOREF.1
IO17: length 37
  Top Layer w0.254: v1(30.94,24.24) 30.94,8.29 32.27,6.95 U3.28
  Bottom Layer w0.254: v1(30.94,24.24) 29.92,25.25 26.8,25.25 25.78,26.27 25.78,27.28 26.86,28.36 26.86,29.76 26.29,30.33 21.72,30.33 NOREF#4.1
ISOCLK: length 35.2
  Top Layer w0.254: U3.8 19.67,10.76 v1(19.69,10.78) ; 46.35,14.95 46.17,14.77 C1.2
  Bottom Layer w0.254: v1(19.69,10.78) 34.16,10.78 40,16.62 44.69,16.62 46.35,14.95
ISODT: length 29.2
  Top Layer w0.254: U3.9 v1(19.69,9.49) ; C2.1 41.46,14.77 41.28,14.95
  Bottom Layer w0.254: v1(19.69,9.49) 35.81,9.49 41.28,14.95
KEY1: length 37.3
  Top Layer w0.254: 41.28,29.45 41.28,19.41 v1(40.13,18.27) ; v1(19.81,13.31) 16.54,13.31 U3.6
  Bottom Layer w0.254: v1(40.13,18.27) 35.18,13.31 v1(19.81,13.31)
KEY2: length 29.9
  Top Layer w0.254: v1(18.54,12.55) 18.02,12.03 U3.7
  Bottom Layer w0.254: v1(18.54,12.55) 18.54,15.98 16.64,17.89 8,17.89 4.7,21.19 4.7,29.45
LED_LS: length 50.2
  Top Layer w0.254: U3.23 29.97,3.79 27.69,6.08 27.69,26.78 v1(27.05,27.41) ; LED2.2 48.01,31.48 v1(45.97,31.48)
  Bottom Layer w0.254: v1(27.05,27.41) 35.81,27.41 36.45,26.78 41.28,26.78 v1(45.97,31.48)
LED_W: length 52
  Top Layer w0.254: U3.10 25.89,8.22 26.92,9.25 26.92,26.02 v1(27.05,26.14) ; 48.02,29.7 48.26,29.46 v1(48.26,28.17)
  Bottom Layer w0.254: v1(27.05,26.14) 27.18,26.27 47.37,26.27 48.26,27.16 v1(48.26,28.17)
RES: length 28.6
  Top Layer w0.254: OLED1.5 28.19,28.85 28.19,6.58 31.24,3.54 U3.24
RXD: length 21.5
  Top Layer w0.254: H5.5 48.39,4.93 41.53,4.93 38.48,7.98 38.48,12.93 36.84,14.57 U3.34
S_CHARGE: length 23.6
  Top Layer w0.254: v1(0.76,28.56) 0.76,29.27 LED4.1
  Bottom Layer w0.254: v1(0.76,28.56) 0.76,27.92 3.56,25.13 3.56,21.19 0.64,18.27 0.64,10.65 1.78,9.5 H6.4
SCL1: length 37.5
  Top Layer w0.254: OLED1.3 25.74,31.6 31.73,31.6 32.25,31.08 32.25,30.72 32.64,30.33 34.54,30.33 35.18,29.7 35.18,28.05 32.26,25.13 32.26,10.14 32.89,9.5 34.51,9.5 U3.30
SCL2: length 21.8
  Top Layer w0.254: H5.3 47.24,7.85 41.15,7.85 39.88,9.12 39.88,14.08 36.84,17.11 U3.36
SDA1: length 21.6
  Top Layer w0.254: U3.37 v1(36.58,18.38)
  Bottom Layer w0.254: v1(36.58,18.38) 30.11,18.38 24.76,23.73 24.76,28.08 OLED1.4
SDA2: length 21.8
  Top Layer w0.254: U3.33 36.59,13.3 37.85,12.05 37.85,7.6 41.15,4.3 46.74,4.3 48.9,2.14 H5.6
TXD: length 20.6
  Top Layer w0.254: U3.35 36.72,15.84 39.12,13.44 39.12,9 41.15,6.97 H5.4
$1N1695: length 8.3
  Top Layer w0.254: R13.1 9.27,31.47 LED3.2 LED4.2
$1N1722: length 13.1
  Top Layer w0.254: LED1.1 49.62,28.01 48.64,27.03 44.58,27.03 43.43,28.17 43.43,30.2 R6.1
$1N1723: length 7.1
  Top Layer w0.254: R16.1 44.46,30.71 48.9,30.71 49.62,31.44 LED2.1

## Copper pours and planes (outline as drawn; the poured copper is in the pictures)
GND on Top Layer: -1.78,35.29 55.37,35.29 55.37,-1.54 -1.78,-1.54
GND on Bottom Layer: -4.57,37.32 59.56,37.32 59.56,-7.77 -4.57,-7.77

## Text on the board
Bottom Silkscreen Layer: G | 16 | By Minigun   25.7.27 | ESP32测光计 上板v1.1
Top Silkscreen Layer: R | G | BT

# Board PCB2
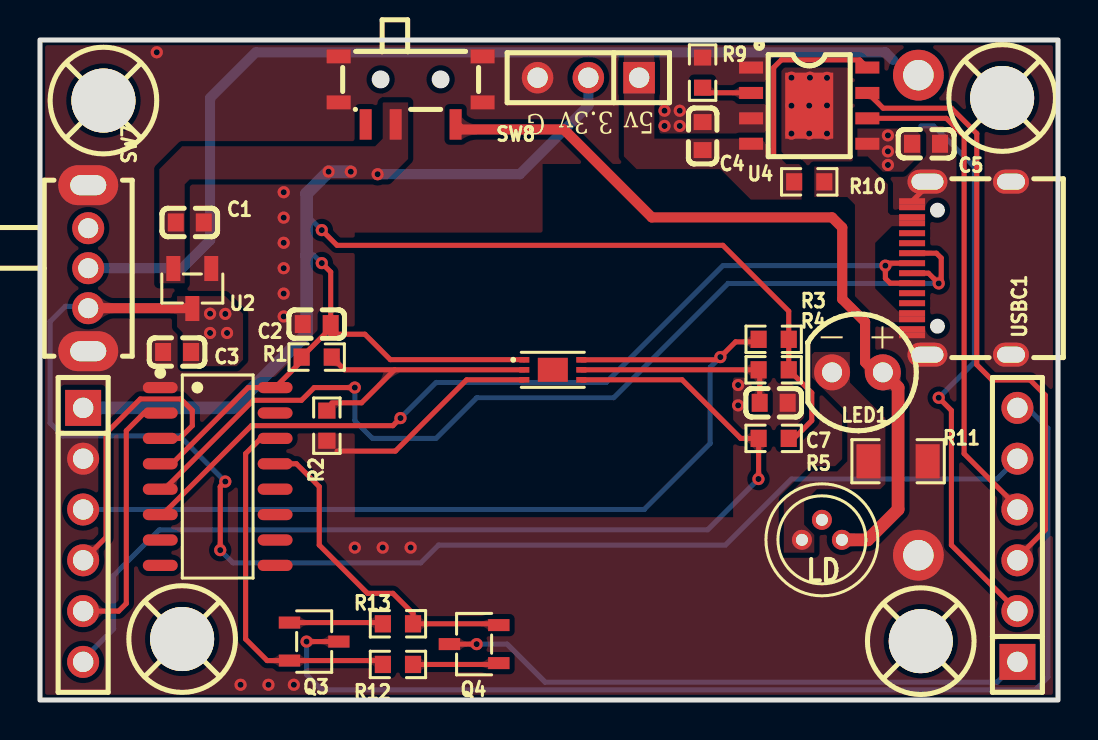
[diagram p4: board, top side]
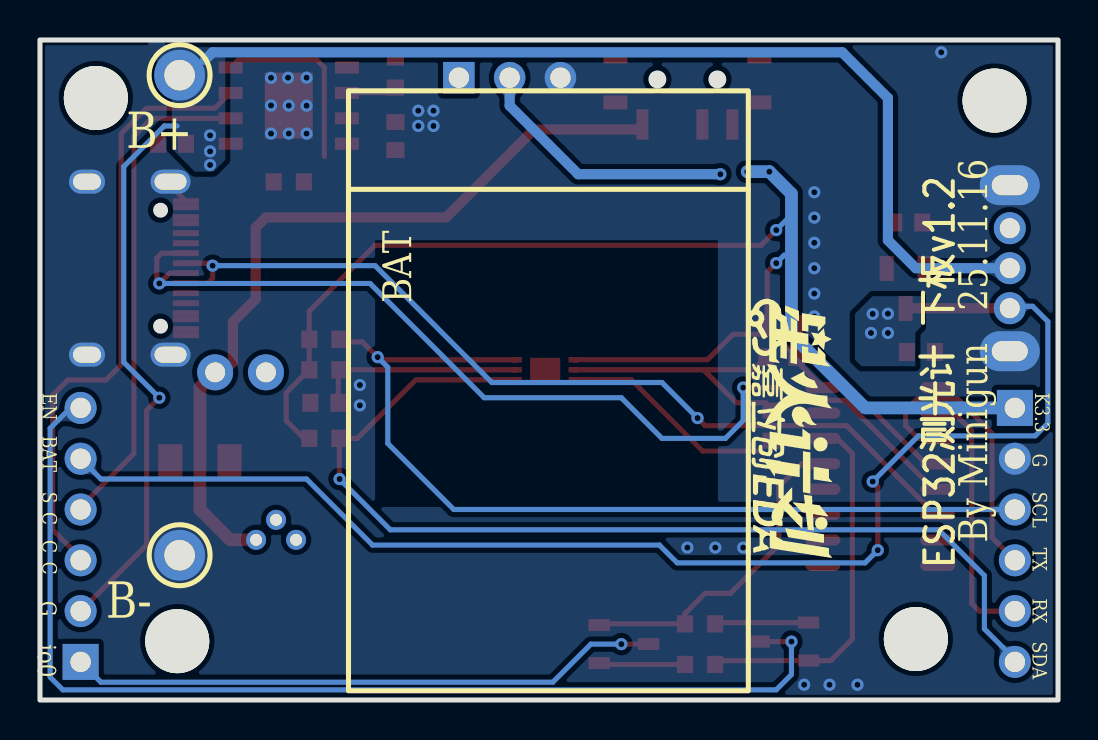
[diagram p5: board, bottom side, seen from below]

Outline 50.93 x 33 mm; copper layers: Top Layer, Bottom Layer. Coordinates in mm from the lower left corner of the outline.
Outline path: rectangle 0,33 50.93,0
Stack: Top Layer 0.035mm / Dielectric1 1.51mm FR4 er 4.5 / Bottom Layer 0.035mm

## Design rules (mm)
spacing copperThickness1oz (default): track to track 0.102, other pairs 0.152 to 0.3
spacing copperThickness2oz: track to track 0.203, other pairs 0.152 to 0.3
spacing Plane_innerPlane: track to track 0.102, other pairs 0.152 to 0.3
spacing Copper_copperRegion: track to track 0.102, other pairs 0.152 to 0.3
track width copperThickness1oz (default): min 0.127, default 0.254, max 2.54
track width copperThickness2oz: min 0.203, default 0.254, max 2.54
differential pair differentialPair (default): width min 0.127, default 0.254, max 2.54; gap min 0.152, default 0.152
pour e241 uses copperRegion1_default, default
pour e246 uses Copper_copperRegion, copperRegion1_Copper_copperRegion

## Placement (name value [footprint] x y rotation side)
C1  10uf  [C0603]  7.49 23.88 0 top
C2  10uF  [C0603]  13.84 18.8 180 top
C3  10uf  [C0603]  6.86 17.4 0 top
C4  10uF  [C0603]  33.15 28.19 270 top
C5  10uF  [C0603]  44.32 27.81 180 top
C7  100nF  [C0603]  36.7 14.86 180 top
D1  GH05035A2G  [OPTO-TH_GH05035A2G]  39.12 8.51 270 top
H1  -  [HDR-TH_6P-P2.54-V-F]  2.16 8.25 270 top
H2  -  [HDR-TH_6P-P2.54-V-F]  48.9 8.25 90 top
H3  -  [HDR-TH_3P-P2.54-V-F]  27.43 31.11 180 top
LED1  XL-502SURD  [LED-TH_BD5.9-P2.54-RD_RED]  40.89 16.38 0 top
NOREF  -  [Pad_e47]  43.94 7.24 0 top
NOREF#2  -  [Pad_e46]  43.94 31.24 0 top
Q3  -  [SOT-23-3_L2.9-W1.6-P1.90-LS2.8-BR]  13.72 2.92 180 top
Q4  -  [SOT-23-3_L2.9-W1.6-P1.90-LS2.8-BR]  21.72 2.79 0 top
R1  10K  [R0603]  13.84 17.14 0 top
R2  10K  [R0603]  14.35 13.72 90 top
R3  10K  [R0603]  36.7 18.03 0 top
R4  1K  [R0603]  36.7 16.51 0 top
R5  10K  [R0603]  36.7 13.08 0 top
R9  4.7k  [R0603]  33.15 31.37 270 top
R10  0  [R0603]  38.48 25.91 180 top
R11  10K  [R1206]  42.93 11.94 0 top
R12  10KΩ  [R0603_2]  17.91 1.78 180 top
R13  10KΩ  [R0603_2]  17.91 3.81 0 top
SCREW1  -  [M3螺丝]  48.13 30.1 0 top
SCREW2  -  [M3螺丝]  3.17 29.97 0 top
SCREW3  -  [M3螺丝]  7.11 3.05 0 top
SCREW4  -  [M3螺丝]  44.06 2.94 0 top
SW7  SK12D07VG5  [SW-TH_SK12D07VG5]  2.41 21.59 270 top
SW8  MSK12C02  [SW-TH_MSK12C02]  18.54 30.48 180 top
U1  BH1750FVI-TR  [WSOF-6_L2.6-W1.6-P0.50-TL-EP]  25.65 16.51 0 top
U2  662K  [SOT-23-3_L2.9-W1.3-P1.90-LS2.4-BR]  7.62 20.57 90 top
U4  TP4056  [ESOP-8_L4.9-W3.9-P1.27-LS6.0-BL-EP]  38.48 29.72 270 top
U7  -  [SOP-16_L10.0-W3.9-P1.27-LS6.0-BL]  8.89 11.18 270 top
USBC1  TYPE-C-31-M-12  [USB-C_SMD-TYPE-C-31-M-12]  46.1 21.59 90 top

## Footprints (pads in the part's own frame, mm; a bottom-side part is the same pattern mirrored in y, then rotated)
C0603
  rect 0.8x0.9 smd: 1(-0.7,0) 2(0.7,0)
ESOP-8_L4.9-W3.9-P1.27-LS6.0-BL-EP
  rect 0.6x1.2 smd: 1(-1.905,-2.909) 2(-0.635,-2.909) 3(0.635,-2.909) 4(1.905,-2.909) 5(1.905,2.909) 6(0.635,2.909) 7(-0.635,2.909) 8(-1.905,2.909)
  rect 3.3x2.4 smd: 9(0,0)
HDR-TH_3P-P2.54-V-F
  rect 1.575x1.575 hole 1.02: 1(-2.54,0)
  round 1.575 hole 1.02: 2(0,0) 3(2.54,0)
HDR-TH_6P-P2.54-V-F
  rect 1.8x1.8 hole 1.02: 1(-6.35,0)
  round 1.6 hole 1.02: 2(-3.81,0) 3(-1.27,0) 4(1.27,0) 5(3.81,0) 6(6.35,0)
LED-TH_BD5.9-P2.54-RD_RED
  round 1.8 hole 1: 1(-1.27,0) 2(1.27,0)
M3螺丝
  round 3.2 hole 3.2: 1(0,0)
OPTO-TH_GH05035A2G
  round 1 hole 0.6: 1(0.5,1) 2(-0.5,0) 3(0.5,-1)
Pad_e46
  round 2.54 hole 1.524: 1(0,0)
Pad_e47
  round 2.54 hole 1.524: 1(0,0)
R0603
  rect 0.806x0.864 smd: 1(-0.753,0) 2(0.753,0)
R0603_2
  rect 0.807x0.864 smd: 1(-0.754,0) 2(0.754,0)
R1206
  rect 1.208x1.701 smd: 1(-1.479,0) 2(1.479,0)
SOP-16_L10.0-W3.9-P1.27-LS6.0-BL
  oval 0.559x1.745 smd: 1(-4.445,-2.873) 2(-3.175,-2.873) 3(-1.905,-2.873) 4(-0.635,-2.873) 5(0.635,-2.873) 6(1.905,-2.873) 7(3.175,-2.873) 8(4.445,-2.873) 9(4.445,2.873) 10(3.175,2.873) 11(1.905,2.873) 12(0.635,2.873) 13(-0.635,2.873) 14(-1.905,2.873) 15(-3.175,2.873) 16(-4.445,2.873)
SOT-23-3_L2.9-W1.3-P1.90-LS2.4-BR
  rect 1.25x0.7 smd: 1(1,-0.95) 2(1,0.95) 3(-1,0)
SOT-23-3_L2.9-W1.6-P1.90-LS2.8-BR
  rect 1.07x0.6 smd: 1(1.235,-0.95) 2(1.235,0.95) 3(-1.235,0)
SW-TH_MSK12C02
  rect 0.6x1.524 smd: 1(-2.25,1.7) 2(0.75,1.7) 3(2.25,1.7)
  rect 1.2x0.7 smd: 4(-3.6,0.6) 4(-3.6,-1.7) 4(3.6,0.6) 4(3.6,-1.7)
SW-TH_SK12D07VG5
  oval 1.6x1.6 hole 1: 1(-2,0) 2(0,0) 3(2,0)
  oval 2x3 hole 1x1.8: 4(4.15,0) 5(-4.15,0)
USB-C_SMD-TYPE-C-31-M-12
  oval 1.2x2 hole 0.8x1.6: 0(-4.325,1.706) 1(4.325,1.706)
  oval 1.2x1.8 hole 0.8x1.4: 2(4.325,-2.474) 3(-4.325,-2.474)
  rect 0.3x1.3 smd: A1(-3.35,2.474) A4(-2.55,2.474) A5(-1.25,2.474) A6(-0.25,2.474) A7(0.25,2.474) A8(1.25,2.474) A9(2.55,2.474) A12(3.35,2.474) B1(3.05,2.474) B4(2.25,2.474) B5(1.75,2.474) B6(0.75,2.474) B7(-0.75,2.474) B8(-1.75,2.474) B9(-2.25,2.474) B12(-3.05,2.474)
WSOF-6_L2.6-W1.6-P0.50-TL-EP
  rect 0.505x0.28 smd: 1(-1.427,0.5) 2(-1.427,0) 3(-1.427,-0.5) 4(1.427,-0.5) 5(1.427,0) 6(1.427,0.5)
  rect 1.5x1.2 smd: 7(0,0)

## Nets
As in the schematic, except:
GND: C1.2 C2.2 C3.1 C4.1 C5.1 C7.1 H1.2 H3.3 NOREF.1 R2.1 R9.1 R11.2 SW7.4 SW7.5 SW8.4 U1.3 U2.1 U4.1 U4.3 U4.9 U7.1 USBC1.0 USBC1.1 USBC1.2 USBC1.3 USBC1.A1 USBC1.A12 USBC1.B1 USBC1.B12
BAT: C5.2 H2.2 NOREF#2.1 SW7.2 U4.5

Pads without a net: D1 2; SCREW1 1; SCREW2 1; SCREW3 1; SCREW4 1; SW7 1; SW8 3; U1 7; U7 7 8 9 10 11 12 15; USBC1 A5 A8 B5 B8

## Via types
v1: diameter 0.61, hole 0.305, Top Layer to Bottom Layer, 51 vias

## Routing (per net, layer and track width the routed paths; a pad name or vN(x,y) marks a point on that pad's centre or on a via; arc(x,y) is an arc through that point)
+3.3V: length 95.1
  Top Layer w0.254: v1(14.1,21.84) 14.54,21.4 14.54,18.6 ; 14.54,18.6 R1.1 13.09,16.95 11.76,15.62 10.41,15.62 6.6,11.81 U7.4 ; 14.54,18.6 14.54,18.29 16.26,18.29 17.53,17.02 24.22,17.02 U1.1 ; v1(14.1,23.5) 14.86,22.73 34.16,22.73 37.46,19.44 R3.2 R4.2 38.61,15.36 38.61,13.97 37.72,13.08 R5.2
  Bottom Layer w0.254: v1(14.1,23.5) 13.59,24 ; v1(14.1,21.84) 13.7,22.24 13.34,22.24
  Bottom Layer w0.508: v1(16.89,26.29) 24,26.29 27.43,29.72 H3.2
  Bottom Layer w0.635: H1.1 9.65,14.61 ; v1(15.55,26.42) v1(14.44,26.42) 13.34,25.31 13.34,18.29 9.78,14.73
+5V: length 9.4
  Top Layer w0.254: U4.8 41.01,32 37.08,32 36.7,31.62 36.7,27.18
GND: length 12.1
  Top Layer w0.254: USBC1.A12 44.4,25.71 USBC1.1 ; U1.3 21.34,16.01 17.78,12.45 14.86,12.45
  vias: v1(5.84,32.39) v1(10.03,0.76) v1(11.43,0.76) v1(12.19,25.39) v1(12.19,24.12) v1(12.19,22.86) v1(12.19,21.59) v1(12.19,20.32) v1(12.19,19.18) v1(12.7,0.76) v1(15.75,7.62) v1(17.15,7.62) v1(18.54,7.62) v1(31.24,29.46) v1(31.24,28.7) v1(32,29.46) v1(32,28.7) v1(34.93,15.75) v1(34.93,14.73) v1(37.59,31.11) v1(37.59,29.71) v1(37.59,28.32) v1(38.52,31.11) v1(38.48,29.72) v1(38.48,28.32) v1(39.37,31.11) v1(39.37,29.73) v1(39.37,28.32)
BAT: length 77.2
  Top Layer w0.254: v1(44.96,15.11) 45.59,14.48 45.59,7.75 H2.2
  Bottom Layer w0.254: v1(44.96,15.11) 46.74,16.89 46.74,26.67 44.7,28.7 44.07,28.7
  Bottom Layer w0.508: SW7.2 7.11,21.59 8.51,22.99 8.51,30.1 10.79,32.39 42.29,32.39 42.67,32
  vias: v1(42.42,28.23) v1(42.42,27.43) v1(42.42,26.75)
C_CHARGE: length 30.8
  Top Layer w0.254: 41.39,30.35 41.41,30.35 42.18,29.59 45.59,29.59 46.86,28.32 46.86,16.76 47.62,16 49.53,16 50.29,15.24 50.29,8.51 48.9,7.11 H2.3
D+: length 50.7
  Top Layer w0.254: U7.5 6.22,10.54 10.67,14.99 13.08,14.99 13.72,15.62 v1(15.75,15.62) ; USBC1.A6 44.45,21.34 v1(44.96,20.83) 45.09,20.95 45.09,22.1 44.84,22.34 USBC1.B6
  Bottom Layer w0.254: v1(44.96,20.83) 34.42,20.83 28.7,15.11 21.84,15.11 19.81,13.08 16.64,13.08 15.75,13.97 v1(15.75,15.62)
D-: length 44.9
  Top Layer w0.254: USBC1.A7 42.41,21.84 v1(42.29,21.72) 42.29,21.08 42.53,20.84 USBC1.B7 ; U7.6 6.13,9.27 10.57,13.72 17.65,13.72 v1(18.03,14.1)
  Bottom Layer w0.254: v1(18.03,14.1) 19.81,15.88 28.32,15.88 34.16,21.72 v1(42.29,21.72)
DTR: length 16.5
  Top Layer w0.254: Q4.2 22.89,3.81 R13.2 18.66,4.33 17.65,5.33 16.38,5.33 13.97,7.75 13.97,10.67 12.83,11.81 U7.13
EN: length 55.3
  Top Layer w0.254: Q3.3 v1(13.34,2.92)
  Bottom Layer w0.254: v1(13.34,2.92) 13.34,1.27 14.1,0.51 49.78,0.51 50.42,1.14 50.42,13.59 49.4,14.61 H2.6
IO0: length 29.6
  Top Layer w0.254: Q4.3 v1(21.84,2.79)
  Bottom Layer w0.254: v1(21.84,2.79) 23.37,2.79 25.27,0.89 47.88,0.89 H2.1
KBAT: length 68.4
  Top Layer w0.254: v1(9.02,7.49) 9.02,10.67 v1(9.27,10.92)
  Top Layer w0.508: SW7.3 7.6,19.59 U2.3
  Bottom Layer w0.254: v1(9.02,7.49) 9.65,6.86 19.05,6.86 19.94,7.75 34.29,7.75 37.59,11.05 47.88,11.05 H2.5 ; v1(9.27,10.92) 6.98,13.21 1.14,13.21 0.51,13.84 0.51,18.92 1.27,19.69 2.32,19.69 SW7.3
  vias: v1(8.51,19.31) v1(8.51,18.35) v1(9.27,19.3) v1(9.36,18.35)
RTS: length 18.5
  Top Layer w0.254: R12.2 16.96,1.97 Q3.2 11.36,1.97 10.29,3.05 10.29,12.32 11.05,13.08 U7.14
RXD: length 13
  Top Layer w0.254: U7.2 5.21,14.35 4.32,13.46 4.32,4.83 3.94,4.44 H1.5
S_CHARGE: length 25
  Top Layer w0.254: U4.6 45.34,29.08 46.23,28.19 46.23,12.32 48.9,9.65 H2.4
SCL2: length 46.6
  Top Layer w0.254: U1.6 33.9,17.01 34.8,17.91 35.82,17.91 R3.1
  Bottom Layer w0.254: H1.3 30.23,9.53 33.53,12.83 33.53,16.64 v1(34.04,17.14)
SDA2: length 51.3
  Top Layer w0.254: v1(35.94,11.05) 35.95,11.06 R5.1 35.05,13.08 32.12,16.01 U1.4
  Bottom Layer w0.254: H1.6 2.16,2.03 3.68,3.56 3.68,6.22 5.97,8.51 33.4,8.51 v1(35.94,11.05)
TXD: length 14.7
  Top Layer w0.254: U7.3 6.98,13.08 7.62,13.72 7.62,14.48 7.05,15.05 5.02,15.05 3.3,13.33 3.3,8.13 H1.4
$1N1901: length 2.4
  Top Layer w0.254: 33.15,30.36 35.56,30.36 35.57,30.35
$1N1922: length 13.7
  Top Layer w0.254: 14.6,14.86 16.09,14.86 17.74,16.51 ; 17.74,16.51 U1.2 ; 17.74,16.51 15.23,16.51 R1.2
$1N1925: length 10.5
  Top Layer w0.254: U1.5 R4.1 36,16.46 C7.2
$1N1947: length 40.4
  Top Layer w0.508: SW8.1 21.05,28.53 26.21,28.53 30.61,24.13 39.62,24.13 40.13,23.62 40.13,20.04 41.28,18.9 41.28,16.89 41.78,16.38 LED1.2
  Top Layer w0.635: LED1.2 42.93,15.62 42.93,9.53 41.41,8.01 D1.1
$1N1969: length 4.3
  Top Layer w0.254: R12.1 22.89,1.78 Q4.1
$1N1970: length 4.7
  Top Layer w0.254: R13.1 17.09,3.87 Q3.1

## Copper pours and planes (outline as drawn; the poured copper is in the pictures)
+3.3V on Top Layer: 5.97,29.88 18.41,29.88 18.41,20.83 5.97,20.83
+5V on Top Layer: 29.21,32.26 38.1,32.26 38.1,25.02 29.21,25.02
GND on Top Layer: -3.17,36.58 51.69,36.58 51.69,-0.89 -3.17,-0.89
GND on Bottom Layer: -8.89,42.67 67.31,42.67 67.31,-8.25 -8.89,-8.25
VBUS on Top Layer: 38.74,26.67 44.2,26.67 44.2,18.89 38.74,18.89
BAT on Top Layer: 40.89,28.58 44.08,28.58 44.08,26.42 40.89,26.42
BAT on Bottom Layer: 41.66,32.64 45.09,32.64 45.09,26.42 41.66,26.42
KBAT on Top Layer: 6.86,20.19 10.16,20.19 10.16,16.69 6.86,16.69
KBAT on Bottom Layer: 6.86,20.19 10.16,20.19 10.16,16.69 6.86,16.69
$1N1948 on Top Layer: 37.21,17.4 42.29,17.4 42.29,7.37 37.21,7.37

Small or netless copper shapes (teardrops, artwork), in the pictures only: 56 on Top Layer, 18 on Bottom Layer

## Text on the board
Bottom Silkscreen Layer: K3.3 | G | SCL | TX | RX | SDA | EN | BAT | S_C | C_C | io0 | By Minigun   25.11.16 | ESP32测光计 下板v1.2 | B+ | B-
Top Silkscreen Layer: LD | G | 3.3v | 5v
